# Altium schematic sheet Sheet2.SchDoc
size A4; SheetNumber: 2; SheetTotal: 2
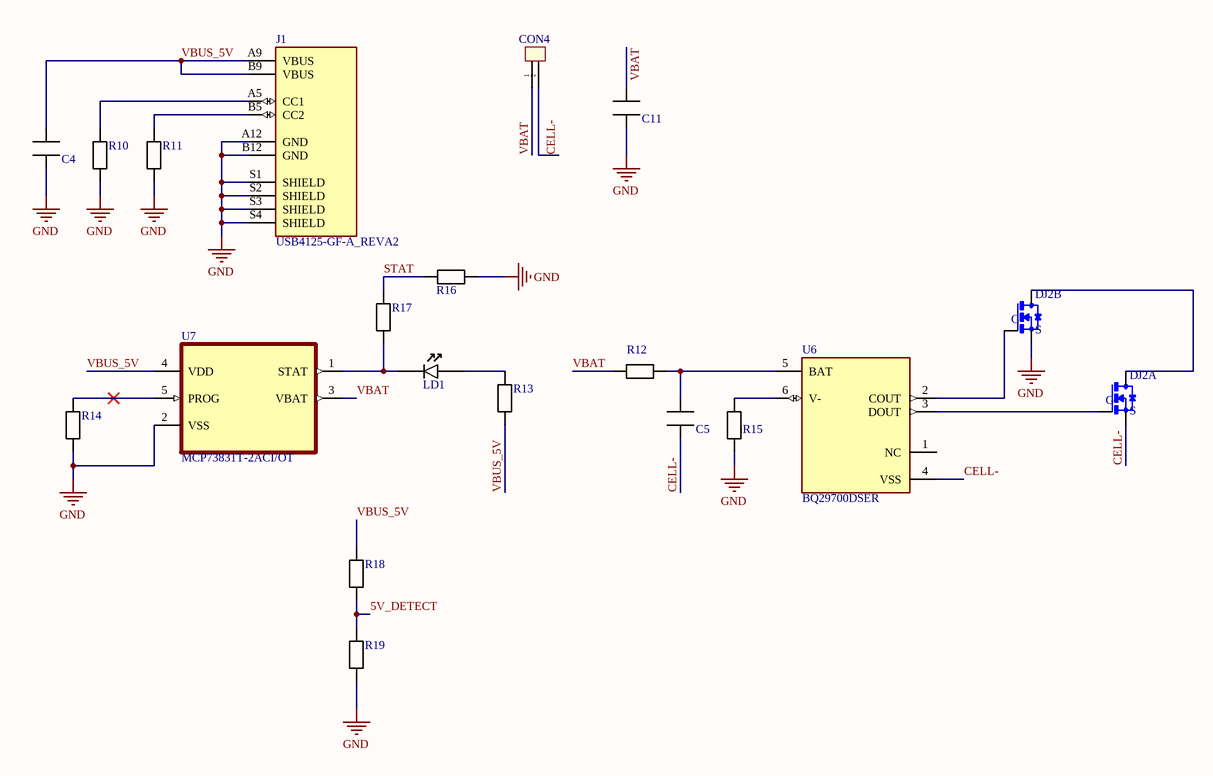
[diagram p0: Sheet2.SchDoc]

## Parts
C4  CAP_0402  [CAP_0402]  (value not drawn)
C5  CAP_0402  [CAP_0402]  (value not drawn)
C11  CAP_0402  [CAP_0402]  (value not drawn)
CON4  1x4 2.54mm THT  [CON_1x2_2.54MM_THT]  (value not drawn)
J1  USB4125-GF-A_REVA2  [GCT_USB4125-GF-A_REVA2]
J2  FDC6305N  [SSOT-6]  (value not drawn)  (parts A,B of 2)
LD1  LED_0402  [LED_0402]  (value not drawn)
R10  RES_0402  [RES_0402]  (value not drawn)
R11  RES_0402  [RES_0402]  (value not drawn)
R12  RES_0402  [RES_0402]  (value not drawn)
R13  RES_0402  [RES_0402]  (value not drawn)
R14  RES_0402  [RES_0402]  (value not drawn)
R15  RES_0402  [RES_0402]  (value not drawn)
R16  RES_0402  [RES_0402]  (value not drawn)
R17  RES_0402  [RES_0402]  (value not drawn)
R18  RES_0402  [RES_0402]  (value not drawn)
R19  RES_0402  [RES_0402]  (value not drawn)
U6  BQ29700DSER  [SON50P150X150X80-6N]
U7  MCP73831T-2ACI/OT  [SOT95P280X145-5N]

## Nets
GND: C4.1 C11.2 J1.A12(GND) J1.B12(GND) J1.S1(SHIELD) J1.S2(SHIELD) J1.S3(SHIELD) J1.S4(SHIELD) J2.2(S) R10.1 R11.1 R14.1 R15.2 R16.1 R19.1 U7.2(VSS)
5V_DETECT: R18.1 R19.2
CELL-: C5.1 CON4.2 J2.5(S) U6.4(VSS)
STAT: R16.2 R17.2
VBAT: C11.1 CON4.1 R12.2 U7.3(VBAT)
VBUS_5V: C4.2 J1.A9(VBUS) J1.B9(VBUS) R13.1 R18.2 U7.4(VDD)
NetC5_2: C5.2 R12.1 U6.5(BAT)
NetJ1_A5: J1.A5(CC1) R10.2
NetJ1_B5: J1.B5(CC2) R11.2
NetJ2_1: J2.1(G) U6.3(DOUT)
NetJ2_3: J2.3(G) U6.2(COUT)
NetJ2_4: J2.4(D) J2.6(D)
NetLD1_1: LD1.1 R17.1 U7.1(STAT)
NetLD1_2: LD1.2 R13.2
NetR14_2: R14.2 U7.5(PROG)
NetR15_1: R15.1 U6.6(V-)

Not connected (* = marked no-connect by the designer): U6 1(NC)

## Library data of the parts
C4 C11 = CAP_0402: val: 4.7u
C5 = CAP_0402: val: 100n
CON4 = CON_1x2_2.54mm_THT: note: any manufacturer; val: 1x4 2.54mm THT
J2 = FDC6305N: Mosfet Array 2 N-Channel (Dual) 20V 2.7A 700mW Surface Mount SuperSOTâ„¢-6; MF: ON Semiconductor; SnapEDA_Link: https://www.snapeda.com/parts/FDC6305N/Onsemi/view-part/?ref=snap; Package: TSOT-23-6 ON Semiconductor; Value: *; MP: FDC6305N; Check_prices: https://www.snapeda.com/parts/FDC6305N/Onsemi/view-part/?ref=eda
R10 R11 = RES_0402: val: 5.1k
R12 = RES_0402: val: 330
R13 = RES_0402: val: 1k
R14 = RES_0402: val: 62k
R15 = RES_0402: val: 2.2k
R16-R19 = RES_0402: val: 100k
U6 = BQ29700DSER: Li-Ion/Li Polymer Advanced Single-Cell Battery Protector IC Family 6-WSON -40 to 85; MF: Texas Instruments; Price: None; Value: *; MP: BQ29700DSER; Availability: Good; SnapEDA_Link: https://www.snapeda.com/parts/BQ29700DSER/Texas%20Instruments/view-part/535836/?ref=snap; Purchase-URL: https://pricing.snapeda.com/search/part/BQ29700DSER/?ref=eda; Package: WSON-6 Texas Instruments
U7 = MCP73831T-2ACI/OT: Charger IC Lithium Ion/Polymer SOT-23-5; MF: Microchip; Package: SOT-23 Microchip; Purchase-URL: https://pricing.snapeda.com/search/part/MCP73831T-2ACI/OT/?ref=eda; MP: MCP73831T-2ACI/OT; Value: *; Availability: In Stock; SnapEDA_Link: https://www.snapeda.com/parts/MCP73831T-2ACI/OT/Microchip/view-part/?ref=snap; Price: None; Check_prices: https://www.snapeda.com/parts/MCP73831T-2ACI/OT/Microchip/view-part/?ref=eda
J1 = USB4125-GF-A_REVA2: Package: None; Availability: Unavailable; MP: USB4125-GF-A_REVA2; Value: *; Price: None